# Altium schematic sheet MWSA0603S-4R7MT.schdoc
size 127 x 101 mm
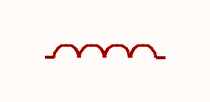
[diagram p0: MWSA0603S-4R7MT.schdoc]

## Parts
L?  mwsa0603s-4r7mt  [IND-SMD_L7.0-W6.6]  (value not drawn)

## Nets

Not connected (* = marked no-connect by the designer): L? 1 2

## Library data of the parts
L? = mwsa0603s-4r7mt: 电感值:4.7uH;精度:±20%;额定电流:6A;饱和电流(Isat):9A;类型:-;; Manufacturer: Sunlord(顺络); AddInBom: yes; ModelId: 6860c29aec394a38a0f014af7f722a42; ModelName: IND-SMD_L7.0-W6.6-H3.0; ModelTransform: 275.59,259.88137,0,0,0,0,0,0,0; Value: 4.7uH; Tolerance: ±20%; Current Rating: 6A; Current - Saturation(Isat): 9A; DC Resistance(DCR): 33mΩ; Symbol: MWSA0603S-4R7MT; LCSC Part Name: 4.7uH ±20% 9A; SupplierPart: C408447; ManufacturerPart: MWSA0603S-4R7MT; Supplier Footprint: SMD,7x6.6mm; JLCPCB Part Class: Extended Part; Datasheet: https://item.szlcsc.com/datasheet/MWSA0603S-4R7MT/397799.html; Supplier: LCSC; ConvertToPcb: yes; FootprintName: IND-SMD_L7.0-W6.6; Type: -; Ratings: -